# Altium schematic sheet LLR-05 (Main-Board-Schematic).SchDoc
size A4; SheetNumber: 1; SheetTotal: 1
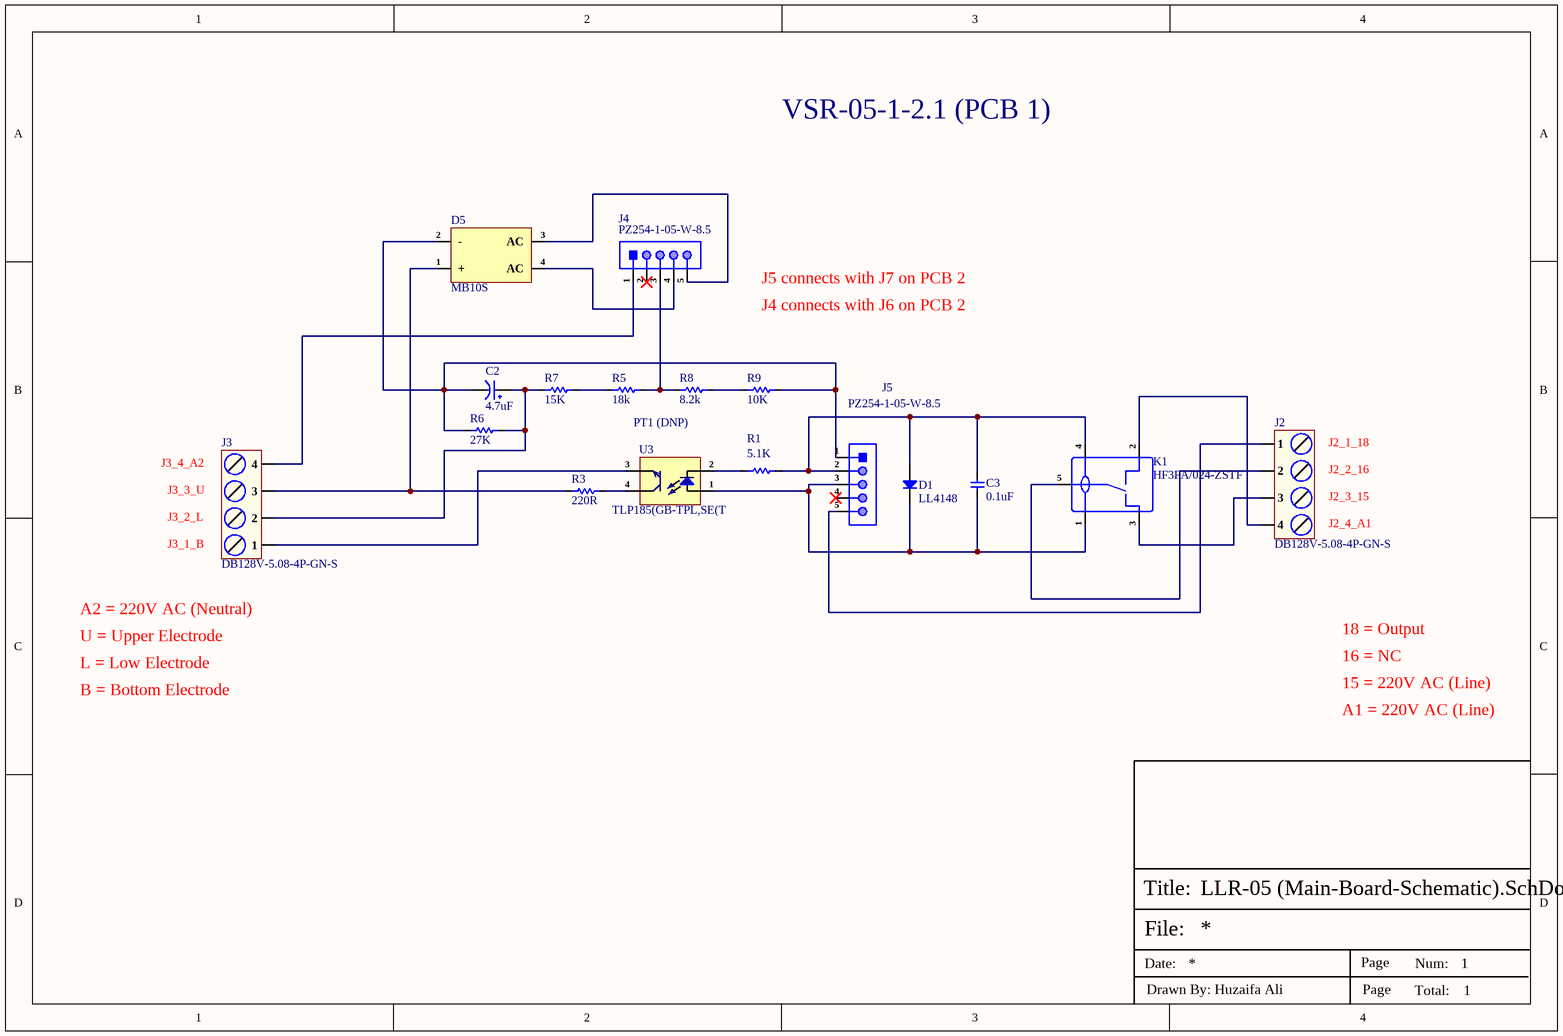
[diagram p0: LLR-05 (Main-Board-Schematic).SchDoc]

## Parts
C2  4.7uF  [VT1H4R7M0405]
C3  0.1uF  [Cap-1206]
D1  LL4148  [LL-34]
D5  MB10S  [MBS10S]
J2  DB128V-5.08-4P-GN-S  [DB128V-5.08-4P-GN-S]
J3  DB128V-5.08-4P-GN-S  [DB128V-5.08-4P-GN-S]
J4  PZ254-1-05-W-8.5  [HDR1X5 (R\A)]
J5  PZ254-1-05-W-8.5  [HDR1X5 (R\A)]
K1  HF3FA/024-ZSTF  [HF3FA/024-ZSTF]
R1  5.1K  [RES-0805]
R3  220R  [Res-1206]
R5  18k  [RES-0805]
R6  27K  [RES-0805]
R7  15K  [RES-0805]
R8  8.2k  [RES-0805]
R9  10K  [RES-0805]
U3  TLP185(GB-TPL,SE(T  [SOP-4_2.54]

## Nets
NetC2_1: C2.1 J3.2 R6.2 R7.1
NetC2_2: C2.2 D5.2(-) J5.1 R6.1 R9.2
NetC3_1: C3.1 D1.2(K) J5.3 K1.1 U3.1(An)
NetC3_2: C3.2 D1.1(A) J5.2 K1.4 R1.2
NetD5_1: D5.1(+) J3.3 R3.1
NetD5_3: D5.3(AC) J4.5
NetD5_4: D5.4(AC) J4.4
NetJ2_1: J2.1 J5.5
NetJ2_2: J2.2 K1.5
NetJ2_3: J2.3 K1.3
NetJ2_4: J2.4 K1.2
NetJ3_1: J3.1 U3.3(E)
NetJ3_4: J3.4 J4.1
NetJ4_3: J4.3 R5.2 R8.1
NetR1_1: R1.1 U3.2(Ca)
NetR3_2: R3.2 U3.4(C)
NetR5_1: R5.1 R7.2
NetR8_2: R8.2 R9.1

Not connected (* = marked no-connect by the designer): J4 2*; J5 4*

## Notes on the sheet
- VSR-05-1-2.1 (PCB 1)
- J5 connects with J7 on PCB 2
- J4 connects with J6 on PCB 2
- PT1 (DNP)
- J2_1_18
- J3_4_A2
- J3_3_U
- J3_2_L
- J2_2_16
- J2_3_15
- J3_1_B
- J2_4_A1
- A2 = 220V AC (Neutral)
- U = Upper Electrode
- 18 = Output
- L = Low Electrode
- B = Bottom Electrode
- A1 = 220V AC (Line)
- 15 = 220V AC (Line)
- 16 = NC
- File:
- Title:
- Date:
- Page
- Num:
- Total:
- Drawn By: Huzaifa Ali

## Library data of the parts
C2 = VT1H4R7M0405: 4.7uF 50V 14mA@120Hz ±20% SMD,D4xL5.4mm Aluminum Electrolytic Capacitors - SMD ROHS; Manufacturer: Roqang; Supplier: LCSC; LCSC Part Number: C213488; Manufacturer Part Number: VT1H4R7M0405; RoHS: No; Item Type: Capacitor
C3 = CC1206KKX7R0BB104: CAP CER 0.1UF 100V X7R 1206; Manufacturer: Yageo; Dielectric Material: Ceramic; Tolerance: 10%; Voltage: 63V; Capacitance: 100nF; Item Type: Capacitor; Supplier 1: Avnet; Manufacturer Part Number: CC1206KKX7R0BB104; RoHS: Yes; Category: Ceramic Capacitors; Stock 1: 24000; Pricing 1: 3000=0.01588, 6000=0.01565, 12000=0.01520, 18000=0.01486, 24000=0.01429, 30000=0.01395, 300000=0.01361 (USD); Mount: Surface Mount; Case/Package: 1206; Number of Pins: 2; Case Code (Metric): 3216; Case Code (Imperial): 1206; Min Operating Temperature: -55°C; Max Operating Temperature: 125°C; Dielectric: X7R; Package Quantity: 1; Voltage Rating: 100V; Packaging: Tape and Reel; Voltage Rating (DC): 100V; Termination: SMD/SMT; Resistor Type: Ceramic; Series: CC; Length: 3.2mm; Width: 0.063inch; Height: 1.25mm; Thickness: 0.057inch; Depth: 1.6mm; Radiation Hardening: No; RoHS Compliant: Yes; Reach SVHC Compliant: Yes; Lead Free: Lead Free; ComponentLink1URL: https://datasheet.ciiva.com/7978/1447671-7978227.pdf?src-supplier=Element14; ComponentLink1Description: https://datasheet.ciiva.com/7978/1447671-7978227.pdf?src-supplier=Element14; ComponentLink2URL: https://datasheet.ciiva.com/46391/1919308-46391993.pdf?src-supplier=Element14; ComponentLink2Description: https://datasheet.ciiva.com/46391/1919308-46391993.pdf?src-supplier=Element14; ComponentLink3URL: https://datasheet.ciiva.com/180/mlccorderingcode-180145.pdf?src-supplier=Digi-Key; ComponentLink3Description: https://datasheet.ciiva.com/180/mlccorderingcode-180145.pdf?src-supplier=Digi-Key; ComponentLink4URL: https://datasheet.ciiva.com/180/mlccorderingcode-180144.pdf?src-supplier=Digi-Key; ComponentLink4Description: https://datasheet.ciiva.com/180/mlccorderingcode-180144.pdf?src-supplier=Digi-Key; ComponentLink5URL: https://datasheet.ciiva.com/180/mlccorderingcode-180146.pdf?src-supplier=Digi-Key; ComponentLink5Description: https://datasheet.ciiva.com/180/mlccorderingcode-180146.pdf?src-supplier=Digi-Key; ComponentLink6URL: https://datasheet.ciiva.com/5425/upy-gp-np0-16v-to-50v-8-5425573.pdf?src-supplier=Mouser; ComponentLink6Description: https://datasheet.ciiva.com/5425/upy-gp-np0-16v-to-50v-8-5425573.pdf?src-supplier=Mouser; ComponentLink7URL: https://datasheet.ciiva.com/16981/upy-np0x7r-mv-100-to-630v-9-16981180.pdf?src-supplier=Future+Electronics; ComponentLink7Description: https://datasheet.ciiva.com/16981/upy-np0x7r-mv-100-to-630v-9-16981180.pdf?src-supplier=Future+Electronics; ComponentLink8URL: https://datasheet.ciiva.com/26829/getdatasheetpartid-403790-26829655.pdf?src-supplier=Verical; ComponentLink8Description: https://datasheet.ciiva.com/26829/getdatasheetpartid-403790-26829655.pdf?src-supplier=Verical; Supplier Part Number 1: CC1206KKX7R0BB104; LCSC Part Number: C107181
D1 = LL4148: 75V 1V@10mA 4ns 200mA LL-34 Switching Diode ROHS; Manufacturer: MDD; Manufacturer Part Number: LL4148; Package: LL-34; LCSC Part Number: C435829; Item Type: Diode; ComponentLink1Description: LCSC; ComponentLink1URL: https://www.lcsc.com/product-detail/Switching-Diode_MDD-Microdiode-Electronics-LL4148_C435829.html
D5 = MB10S: 35A 1.1V@400mA 1A 1kV MBS Bridge Rectifiers ROHS; Manufacturer: MDD; Manufacturer Part Number: MB10S; Package: MBS; JLCPCB Part Number: C2488; Item Type: Bridge Rectifier; ComponentLink1Description: LCSC; ComponentLink1URL: https://www.lcsc.com/product-detail/Bridge-Rectifiers_MCC_MB6S-TP_MB6S-TP_C85619.html?gclid=CjwKCAjwjOunBhB4EiwA94JWsPhP5VxdRhkKtNAXxaeRo8Kbw1z5VNRY74bvbkYd4a4LtLXYHGrsEhoCPX4QAvD_BwE
J2 J3 = DB128V-5.08-4P-GN-S: 1x4P 20A -40℃~+105℃ 300V Green 12~30 Straight 5.08mm 2.5 1 4 Plugin,P=5.08mm Screw terminal ROHS; Manufacturer: DORABO; Manufacturer Part Number: DB128V-5.08-4P-GN-S; Package: Plugin,P=5.08mm; LCSC Part Number: C2915641; Item Type: Screw terminal; ComponentLink1Description: LCSC; ComponentLink1URL: https://www.lcsc.com/product-detail/Screw-terminal_DORABO-DB128V-5-08-4P-GN-S_C2915641.html
J4 J5 = PZ254-1-05-W-8.5: 3A Right-Angle Square Pins 2.5mm 260℃@10S 5P 6mm -40℃~+105℃ 2.54mm Plugin Black 1x5P Push-Pull,P=2.54mm Pin Headers ROHS; Manufacturer: HCTL; Manufacturer Part Number: PZ254-1-05-W-8.5; Package: Push-Pull,P=2.54mm; LCSC Part Number: C2894947; Item Type: Pin Headers; ComponentLink1Description: LCSC; ComponentLink1URL: https://www.lcsc.com/product-detail/Pin-Headers_HCTL-PZ254-1-05-W-8-5_C2894947.html
K1 = HF3FA/024-ZSTF: 24V SPDT (1 Form C) Plugin,15.2x19mm Power Relays ROHS; Manufacturer: HF(Xiamen Hongfa Electroacoustic); Manufacturer Part Number: HF3FA/024-ZSTF; Package: Plugin,15.2x19mm; LCSC Part Number: C194242; Item Type: Power Relay; ComponentLink1Description: LCSC; ComponentLink1URL: https://www.lcsc.com/product-detail/Power-Relays_HF-Xiamen-Hongfa-Electroacoustic-HF3FA-024-ZSTF_C194242.html
R1 = 0805W8F5101T5E: 125mW Thick Film Resistors 150V ±100ppm/℃ ±1% 5.1kΩ 0805 Chip Resistor - Surface Mount ROHS; Manufacturer: UNI-ROYAL; Manufacturer Part Number: 0805W8F5101T5E; Package: 0805; LCSC Part Number: C27834; Item Type: Resistor; ComponentLink1Description: LCSC; ComponentLink1URL: https://www.lcsc.com/product-detail/Chip-Resistor-Surface-Mount_UNI-ROYAL-Uniroyal-Elec-0805W8F5101T5E_C27834.html
R3 = 1206W4F2200T5E: 250mW Thick Film Resistors 200V ±100ppm/℃ ±1% 220Ω 1206 Chip Resistor - Surface Mount ROHS; Manufacturer: Uniroyal; Supplier: LCSC; LCSC Part Number: C17957; Manufacturer Part Number: 1206W4F2200T5E; RoHS: No; Category: LDO; Item Type: Resistor
R5 = 0805W8F1802T5E: 125mW Thick Film Resistors 150V ±100ppm/℃ ±1% 18kΩ 0805 Chip Resistor - Surface Mount ROHS; Manufacturer: Royal Electronic Factory; Value: 18kR; Supplier: Mouser; Supplier Part Number: 303-0805W8F1802T5E; Manufacturer Part Number: 0805W8F1802T5E; RoHS: No; Stock: 80000; Pricing: 10000=0.002 (USD); LCSC Part Number: C17506; Item Type: Resistor
R6 = 0805W8F2702T5E: 125mW Thick Film Resistors 150V ±100ppm/℃ ±1% 27kΩ 0805 Chip Resistor - Surface Mount ROHS; Manufacturer: Royal Electronic Factory; Value: 27kR; Supplier: Mouser; Supplier Part Number: 303-0805W8F2702T5E; Manufacturer Part Number: 0805W8F2702T5E; RoHS: No; Item Type: Resistor; Stock: 75000; Pricing: 10000=0.002 (USD); LCSC Part Number: C17593
R7 = 0805W8F1502T5E: 125mW Thick Film Resistors 150V ±100ppm/℃ ±1% 15kΩ 0805 Chip Resistor - Surface Mount ROHS; Manufacturer: Uniroyal; Supplier: LCSC; LCSC Part Number: C17475; Manufacturer Part Number: 0805W8F1502T5E; RoHS: Yes; Category: LDO; Item Type: Resistor
R8 = 0805W8F8201T5E: 125mW Thick Film Resistors 150V ±100ppm/℃ ±1% 8.2kΩ 0805 Chip Resistor - Surface Mount ROHS; Manufacturer: Royal Electronic Factory; Value: 8.2kR; Supplier: Mouser; Supplier Part Number: 303-0805W8F8201T5E; Manufacturer Part Number: 0805W8F8201T5E; RoHS: No; Item Type: Resistor; Pricing: 10000=0.002 (USD); LCSC Part Number: C17828
R9 = RC0805FR-7W10KL: RES 10K OHM 1% 1/4W 0805; Manufacturer: Yageo; Item Type: Resistor; Supplier: Avnet; Supplier Part Number: 49AK3472; Manufacturer Part Number: RC0805FR-7W10KL; RoHS: Yes; Category: Chip SMD Resistors; Stock: 5000; Pricing: 1=0.153, 25=0.038, 50=0.03, 100=0.02 (USD); LCSC Part Number: C723404
U3 = TLP185(GB-TPL,SE(T: 80V 3.75kV 50mA 300mV@2.4mA,8mA 1 5V 1.25V DC SOP-4-2.54mm Transistor Output Optocoupler ROHS; Manufacturer: TOSHIBA; Manufacturer Part Number: TLP185(GB-TPL,SE(T; Package: SOP-4-2.54mm; LCSC Part Number: C7240; Item Type: Optocoupler; ComponentLink1Description: LCSC; ComponentLink1URL: https://www.lcsc.com/product-detail/Transistor-Output-Optocoupler_TOSHIBA-TLP185-GB-TPL-SE-T_C7240.html